# Altium project TDA7000_1.PrjPcb
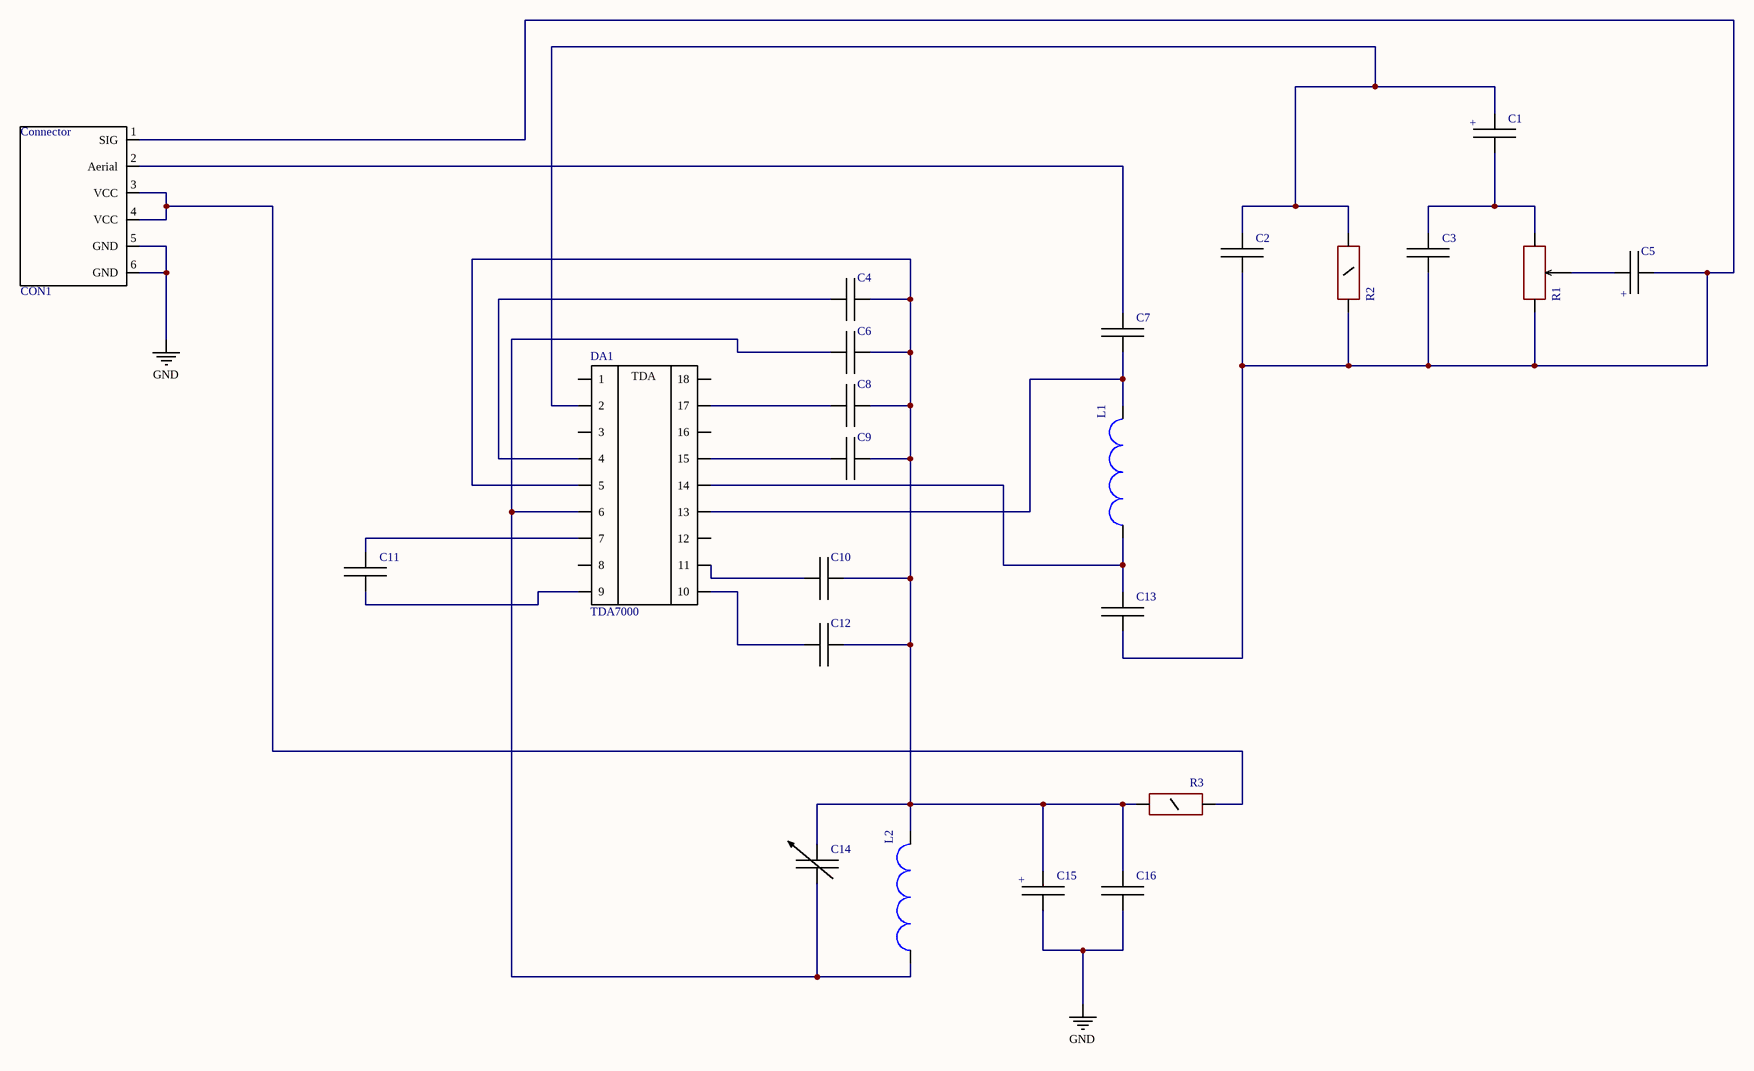
[diagram p0: TDA7000_1.SchDoc]
1 sheet, 23 parts. Net scope: global (net labels, ports and power ports of the same name join across sheets).
Board file: PCBTDA1.PcbDoc

## Sheet TDA7000_1.SchDoc
size A1; SheetNumber: 1; SheetTotal: 1

### Parts
C1  Cp  [100uF (polar)]  (value not drawn)
C2  Capacitor  [1nf]  (value not drawn)
C3  Capacitor  [10nf]  (value not drawn)
C4  Capacitor  [10nf]  (value not drawn)
C5  Cp  [100uF (polar)]  (value not drawn)
C6  Capacitor  [1.8nf]  (value not drawn)
C7  Capacitor  [220pf]  (value not drawn)
C8  Capacitor  [330pf]  (value not drawn)
C9  Capacitor  [0.1uF]  (value not drawn)
C10  Capacitor  [33nf]  (value not drawn)
C11  Capacitor  [33nf]  (value not drawn)
C12  Capacitor  [330pf]  (value not drawn)
C13  Capacitor  [47nf]  (value not drawn)
C14  CV  [ANY_Condenser]  (value not drawn)
C15  Cp  [100uF (polar)]  (value not drawn)
C16  Capacitor  [47nf]  (value not drawn)
CON1  contacts_for_tda7000  [connector]  (value not drawn)
DA1  TDA7000  [DIP18]
L1  Inductor  [ANY_INDUCTOR]  (value not drawn)
L2  Inductor  [ANY_INDUCTOR]  (value not drawn)
R1  RV  [RV]  (value not drawn)
R2  R_for_TDA  [22K]  (value not drawn)
R3  R_for_TDA  [47 ohms]  (value not drawn)

### Nets
GND: C15.1 C16.2 CON1.5(GND) CON1.6(GND)
NetC1_1: C1.1 C3.1 R1.1
NetC1_2: C1.2 C2.1 DA1.2 R2.2
NetC2_2: C2.2 C3.2 C5.1 C13.2 CON1.1(SIG) R1.2 R2.1
NetC4_1: C4.1 C6.1 C8.1 C9.1 C10.1 C12.1 C14.2 C15.2 C16.1 DA1.5 L2.2 R3.2
NetC4_2: C4.2 DA1.4
NetC5_2: C5.2 R1.3
NetC6_2: C6.2 C14.1 DA1.6 L2.1
NetC7_1: C7.1 CON1.2(Aerial)
NetC7_2: C7.2 DA1.13 L1.2
NetC8_2: C8.2 DA1.17
NetC9_2: C9.2 DA1.15
NetC10_2: C10.2 DA1.11
NetC11_1: C11.1 DA1.9
NetC11_2: C11.2 DA1.7
NetC12_2: C12.2 DA1.10
NetC13_1: C13.1 DA1.14 L1.1
NetCON1_3: CON1.3(VCC) CON1.4(VCC) R3.1

Not connected (* = marked no-connect by the designer): DA1 1 3 8 12 16 18

### Notes on the sheet
- (in symbol contacts_for_tda7000) Connector
- (in symbol Cp) +
- (in symbol TDA7000) TDA